# Altium schematic sheet Top_Sheet.SchDoc
size A4; SheetNumber: 1; SheetTotal: 4
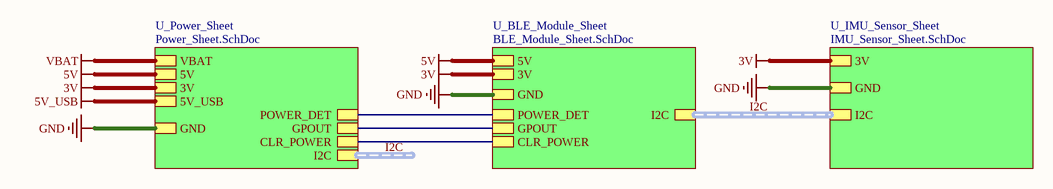
[diagram p0: Top_Sheet.SchDoc]

## Sub-sheets
U_BLE_Module_Sheet = BLE_Module_Sheet.SchDoc: POWER_DET, 5V, GND, 3V, I2C (harness I2C), CLR_POWER, GPOUT
U_IMU_Sensor_Sheet = IMU_Sensor_Sheet.SchDoc: GND, 3V, I2C (harness I2C)
U_Power_Sheet = Power_Sheet.SchDoc: VBAT, 5V, GND, 3V, POWER_DET, CLR_POWER, 5V_USB, GPOUT, I2C (harness I2C)

## Nets
3V: sheet U_BLE_Module_Sheet/3V, sheet U_IMU_Sensor_Sheet/3V, sheet U_Power_Sheet/3V
5V: sheet U_BLE_Module_Sheet/5V, sheet U_Power_Sheet/5V
5V_USB: sheet U_Power_Sheet/5V_USB
GND: sheet U_BLE_Module_Sheet/GND, sheet U_IMU_Sensor_Sheet/GND, sheet U_Power_Sheet/GND
VBAT: sheet U_Power_Sheet/VBAT
(unnamed): sheet U_BLE_Module_Sheet/POWER_DET, sheet U_Power_Sheet/POWER_DET
(unnamed): sheet U_BLE_Module_Sheet/CLR_POWER, sheet U_Power_Sheet/CLR_POWER
(unnamed): sheet U_BLE_Module_Sheet/GPOUT, sheet U_Power_Sheet/GPOUT

## Buses and harness runs
harness I2C = sheet U_BLE_Module_Sheet/I2C = sheet U_IMU_Sensor_Sheet/I2C
harness I2C = sheet U_Power_Sheet/I2C

## Notes on the sheet
- File:
- Title:
- Date:
- Page
- Num:
- Total:
- Drawn By: Huzaifa Ali